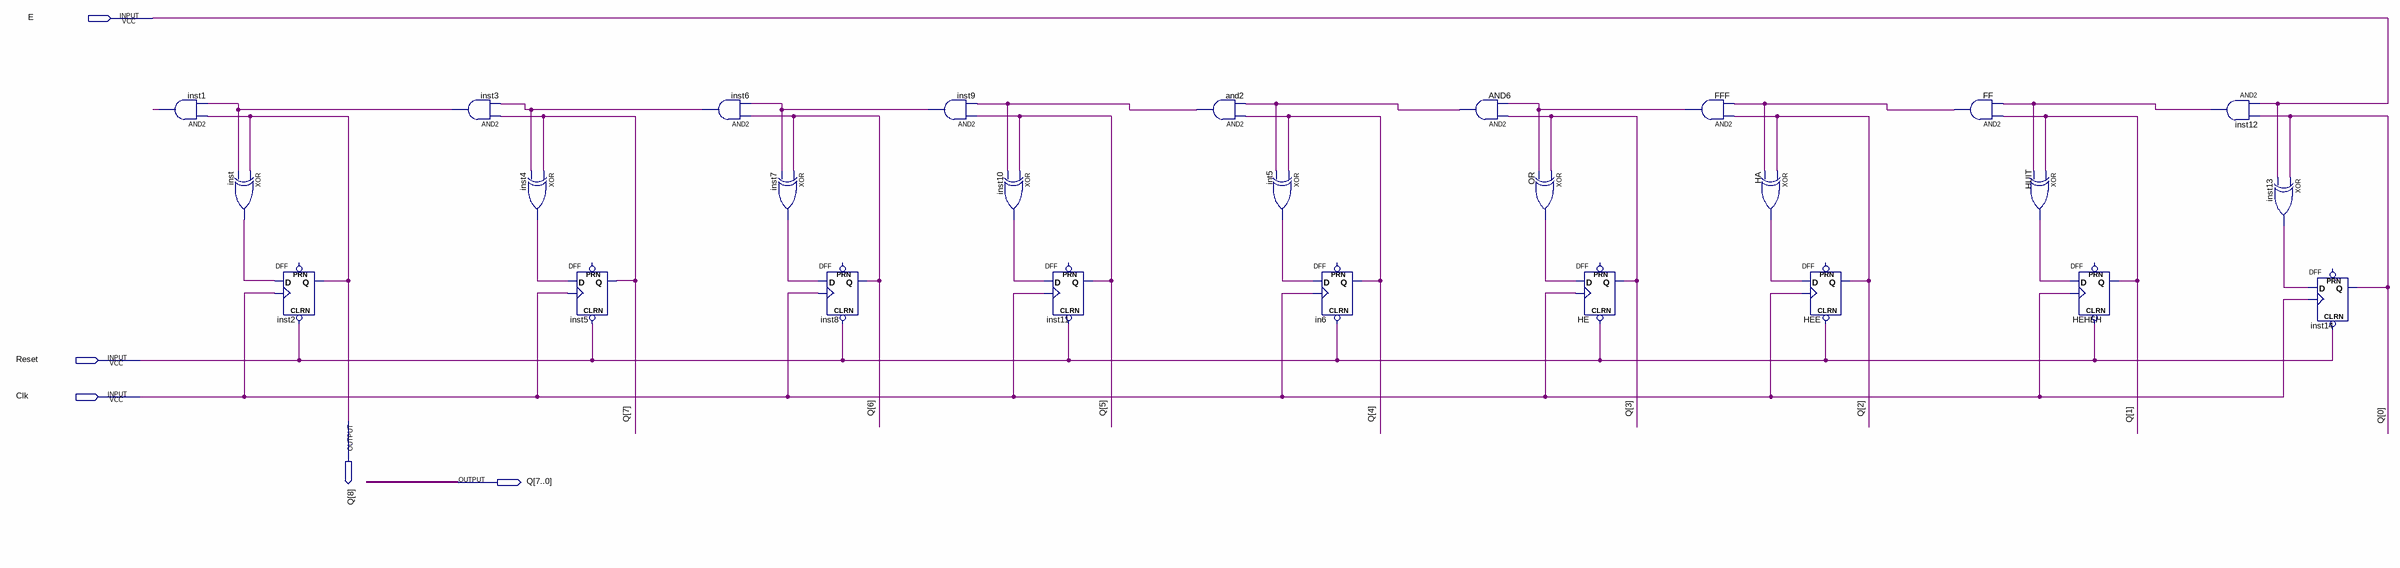
[diagram p0: schematic sheet]
// Quartus schematic 8bitupcounter.bdf as structural Verilog: 27 symbols, 5 pins
module \8bitupcounter  (
  input  E,
  input  Reset,
  input  Clk,
  output [8:0] Q
);

  wire and2_out, AND6_out, FF_out, FFF_out, HA_out, HUIT_out, inst1_out, inst3_out, inst4_out, inst6_out,
       inst7_out, inst9_out, inst10_out, inst12_out, inst13_out, inst_out, int5_out, OR_out;

  and inst1 (inst1_out, Q[8], inst3_out);
  xor inst (inst_out, Q[8], inst3_out);
  DFF inst2 (.CLRN(Reset), .CLK(Clk), .D(inst_out), .Q(Q[8]));  // open: PRN
  and inst3 (inst3_out, Q[7], inst6_out);
  xor inst4 (inst4_out, Q[7], inst6_out);
  DFF inst5 (.CLRN(Reset), .CLK(Clk), .D(inst4_out), .Q(Q[7]));  // open: PRN
  and inst6 (inst6_out, Q[6], inst9_out);
  xor inst7 (inst7_out, Q[6], inst9_out);
  DFF inst8 (.CLRN(Reset), .CLK(Clk), .D(inst7_out), .Q(Q[6]));  // open: PRN
  and inst9 (inst9_out, Q[5], and2_out);
  xor inst10 (inst10_out, Q[5], and2_out);
  DFF inst11 (.CLRN(Reset), .CLK(Clk), .D(inst10_out), .Q(Q[5]));  // open: PRN
  and and2 (and2_out, Q[4], AND6_out);
  xor int5 (int5_out, Q[4], AND6_out);
  DFF in6 (.CLRN(Reset), .CLK(Clk), .D(int5_out), .Q(Q[4]));  // open: PRN
  and AND6 (AND6_out, Q[3], FFF_out);
  xor OR (OR_out, Q[3], FFF_out);
  DFF HE (.CLRN(Reset), .CLK(Clk), .D(OR_out), .Q(Q[3]));  // open: PRN
  and FFF (FFF_out, Q[2], FF_out);
  xor HA (HA_out, Q[2], FF_out);
  DFF HEE (.CLRN(Reset), .CLK(Clk), .D(HA_out), .Q(Q[2]));  // open: PRN
  and FF (FF_out, Q[1], inst12_out);
  xor HUIT (HUIT_out, Q[1], inst12_out);
  DFF HEHEH (.CLRN(Reset), .CLK(Clk), .D(HUIT_out), .Q(Q[1]));  // open: PRN
  and inst12 (inst12_out, E, Q[0]);
  xor inst13 (inst13_out, Q[0], E);
  DFF inst14 (.CLRN(Reset), .CLK(Clk), .D(inst13_out), .Q(Q[0]));  // open: PRN
endmodule
